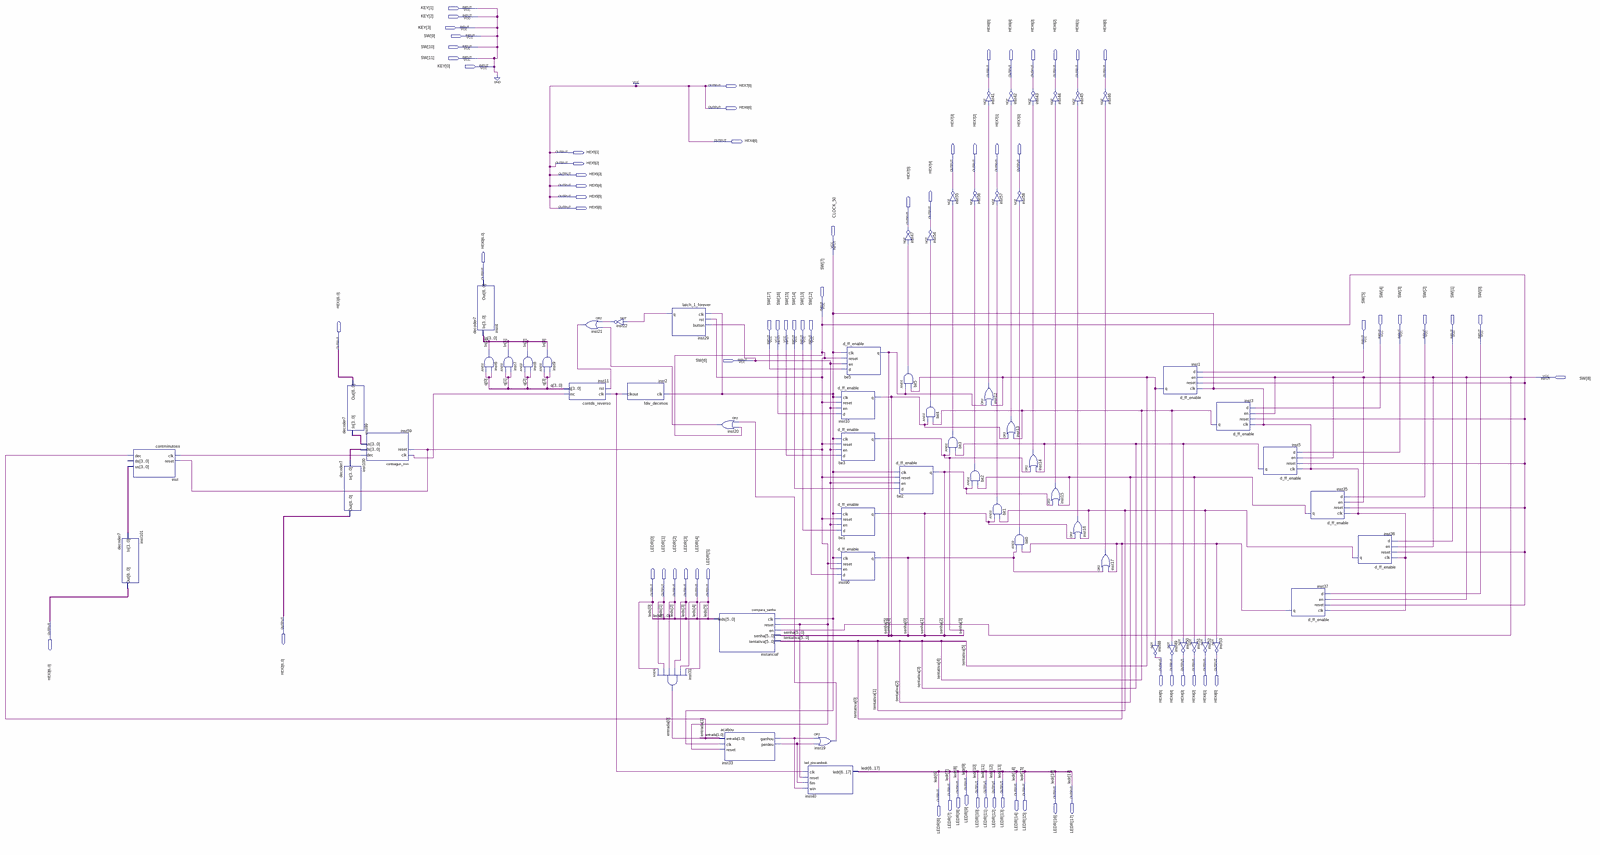
[diagram p0: schematic sheet, whole]
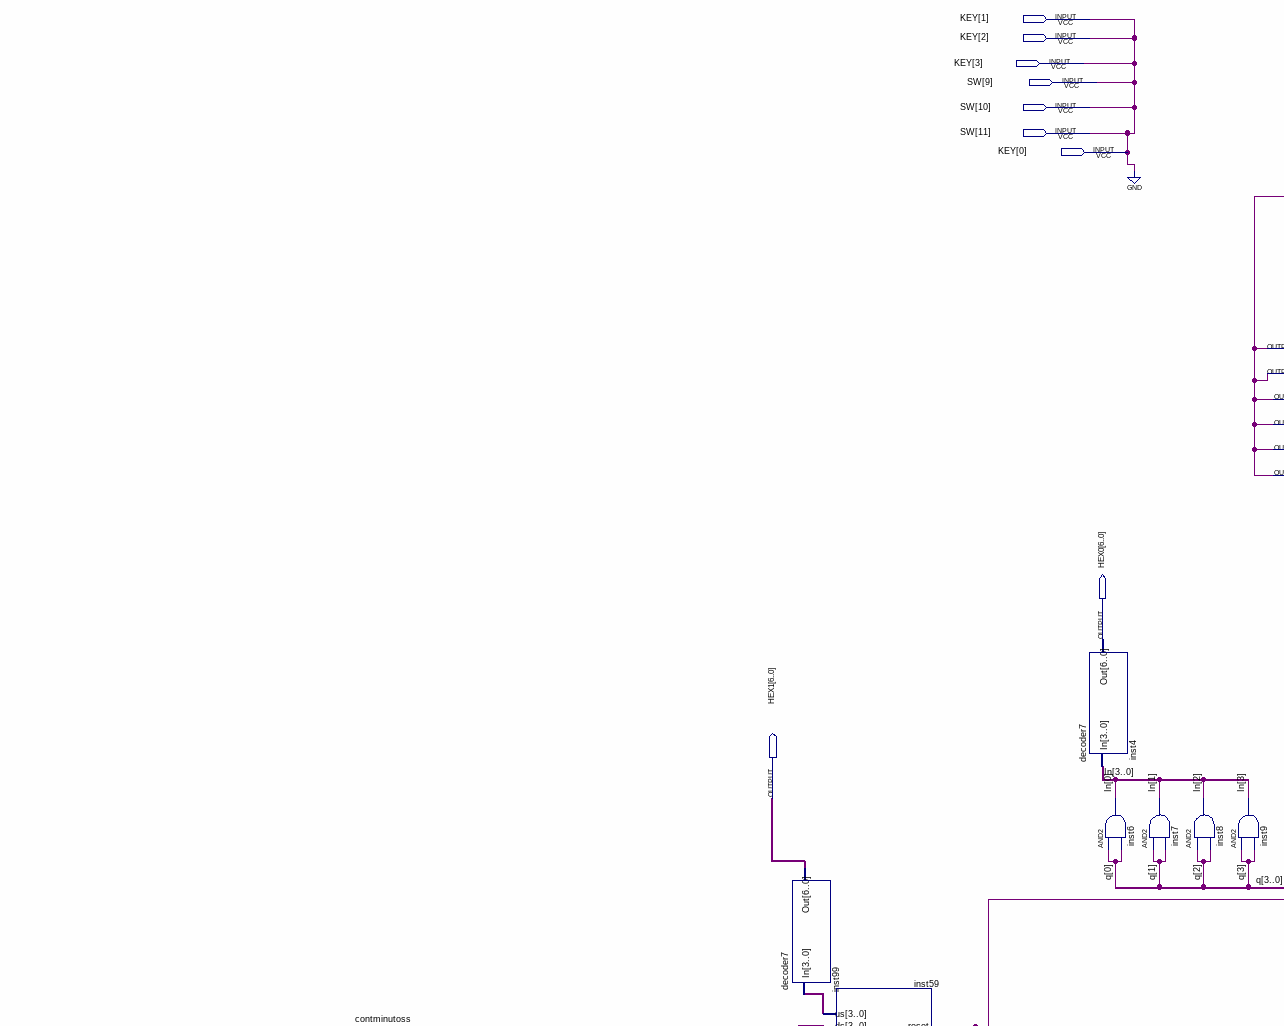
[diagram p1: schematic sheet, upper left part]
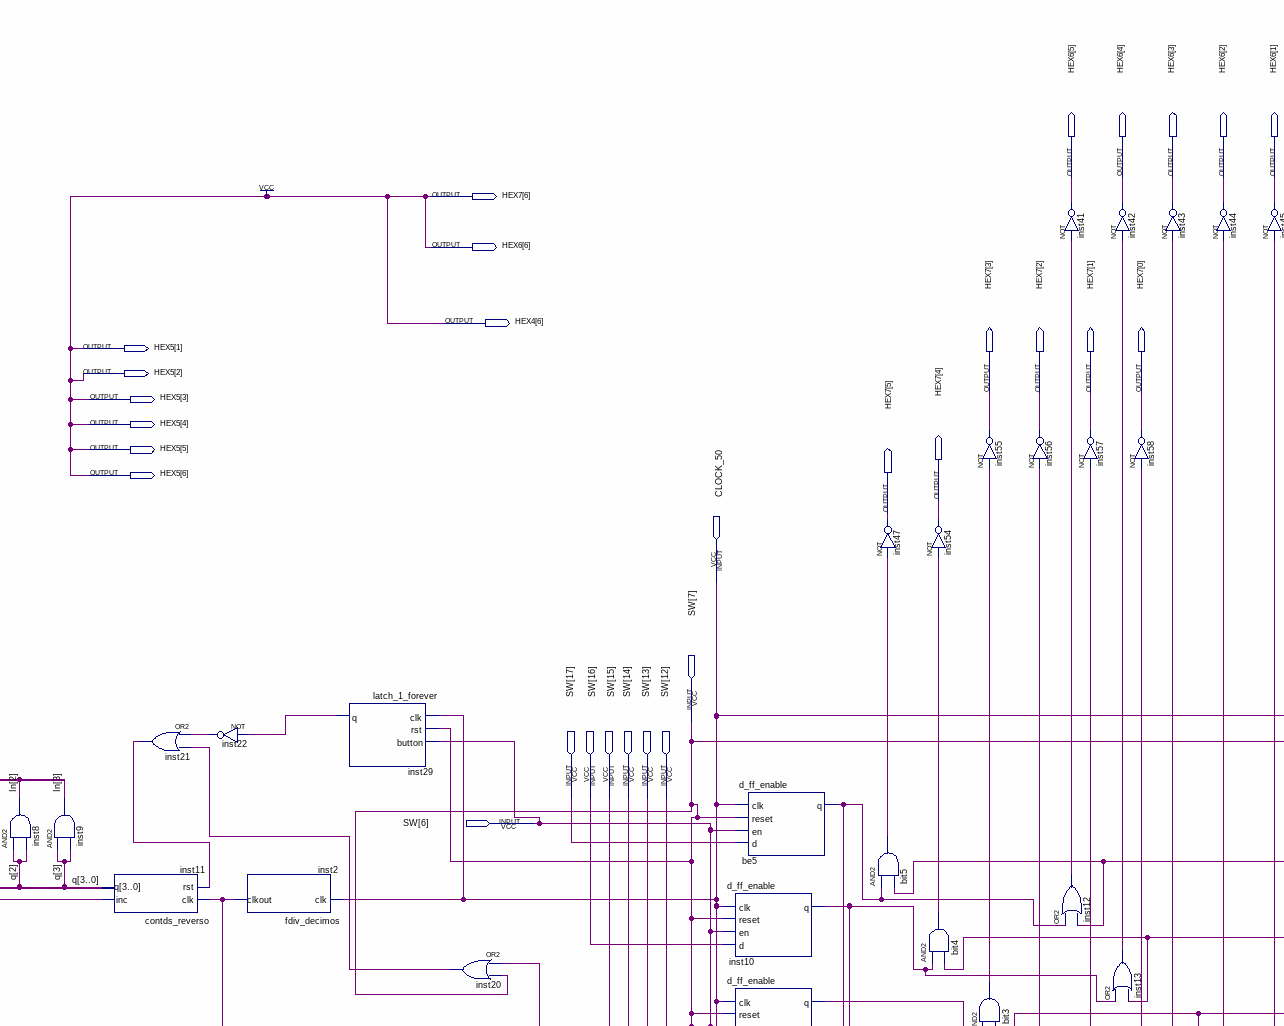
[diagram p2: schematic sheet, upper centre part]
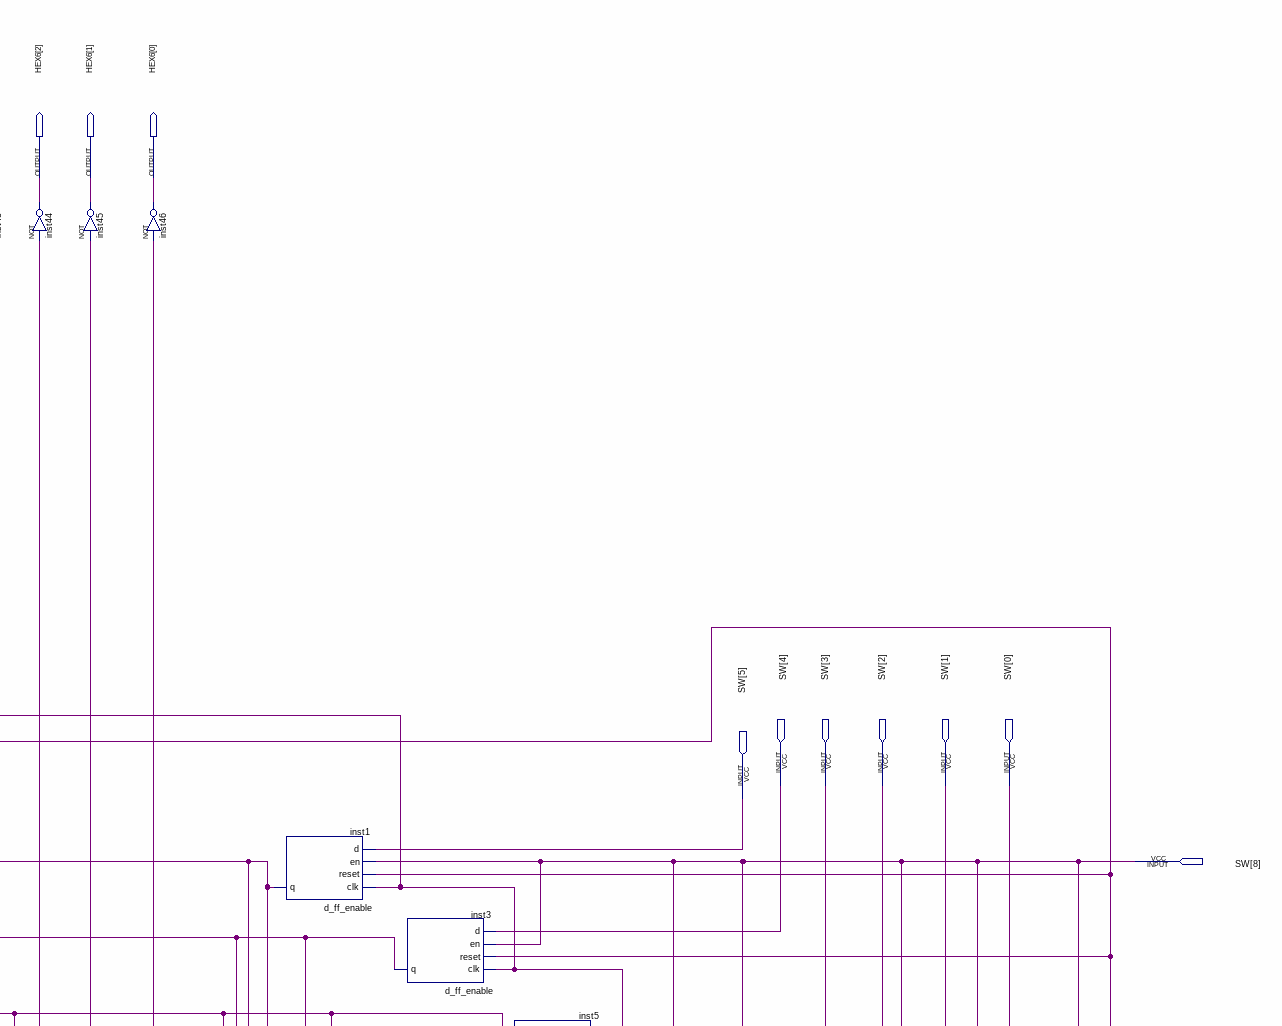
[diagram p3: schematic sheet, upper right part]
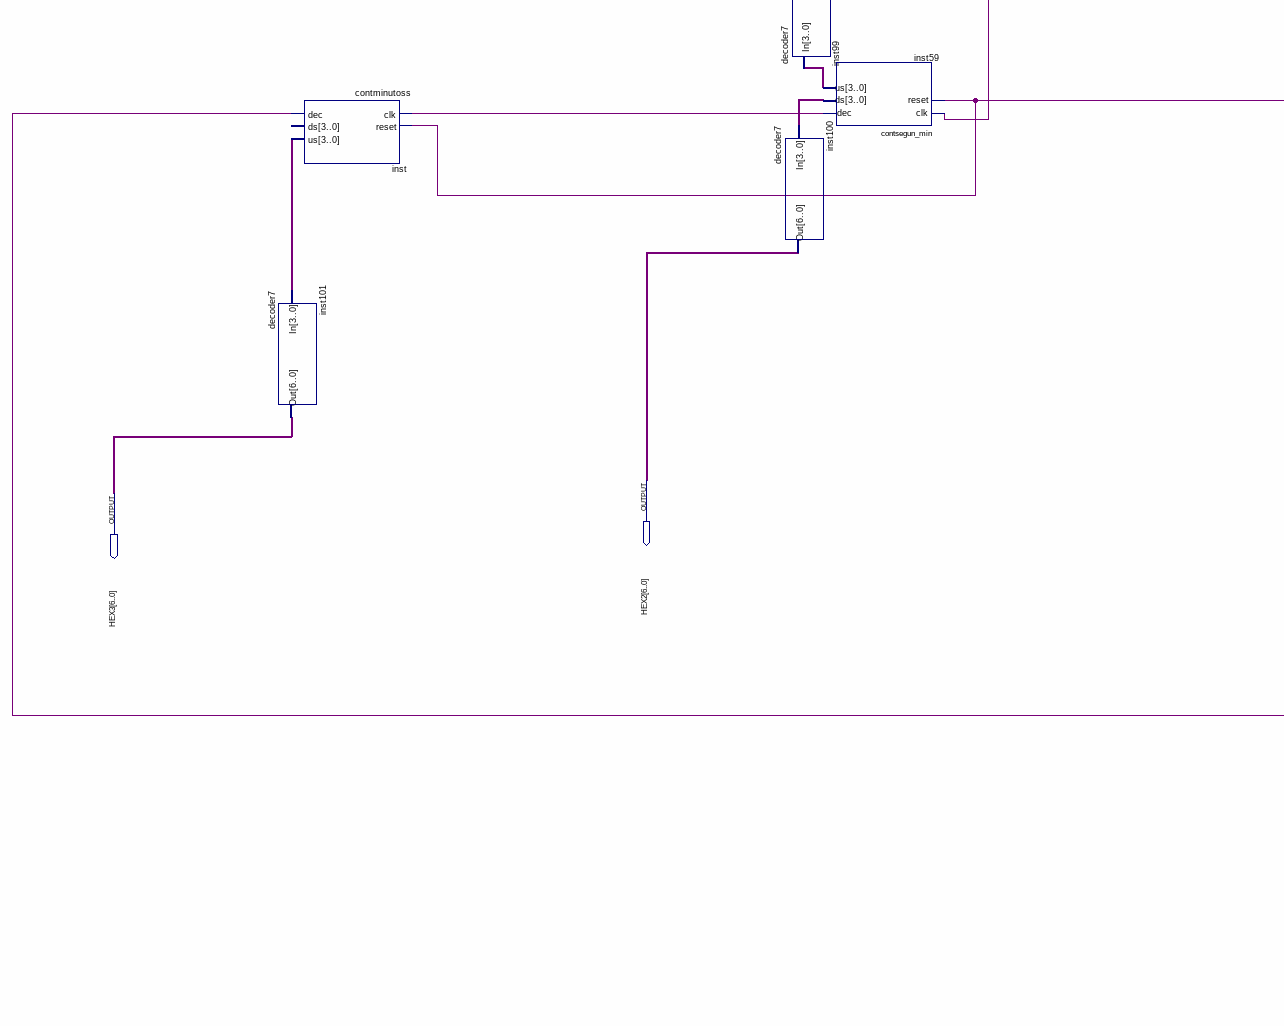
[diagram p4: schematic sheet, lower left part]
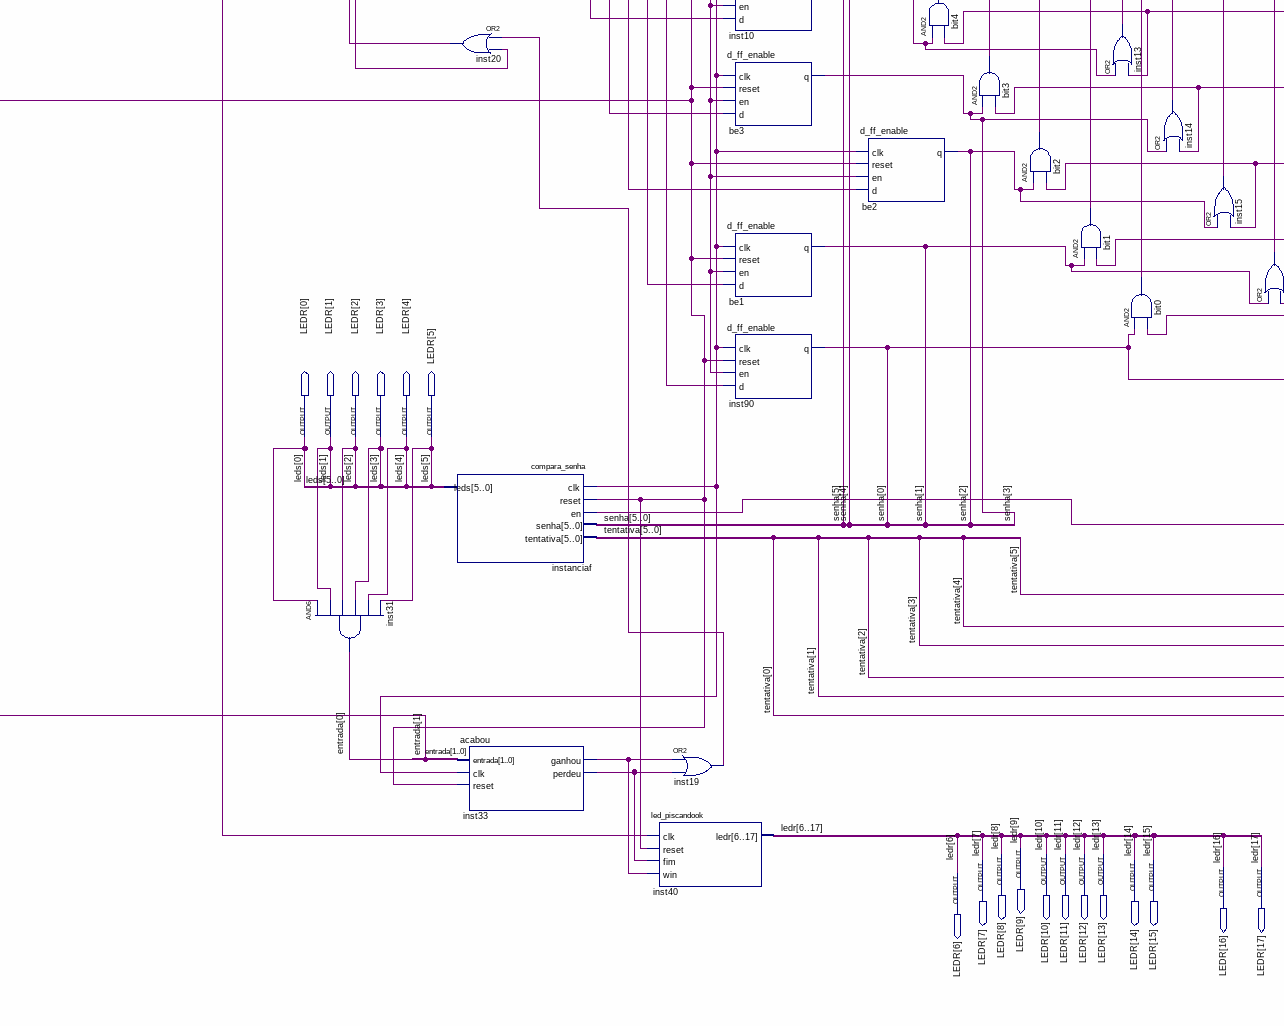
[diagram p5: schematic sheet, lower centre part]
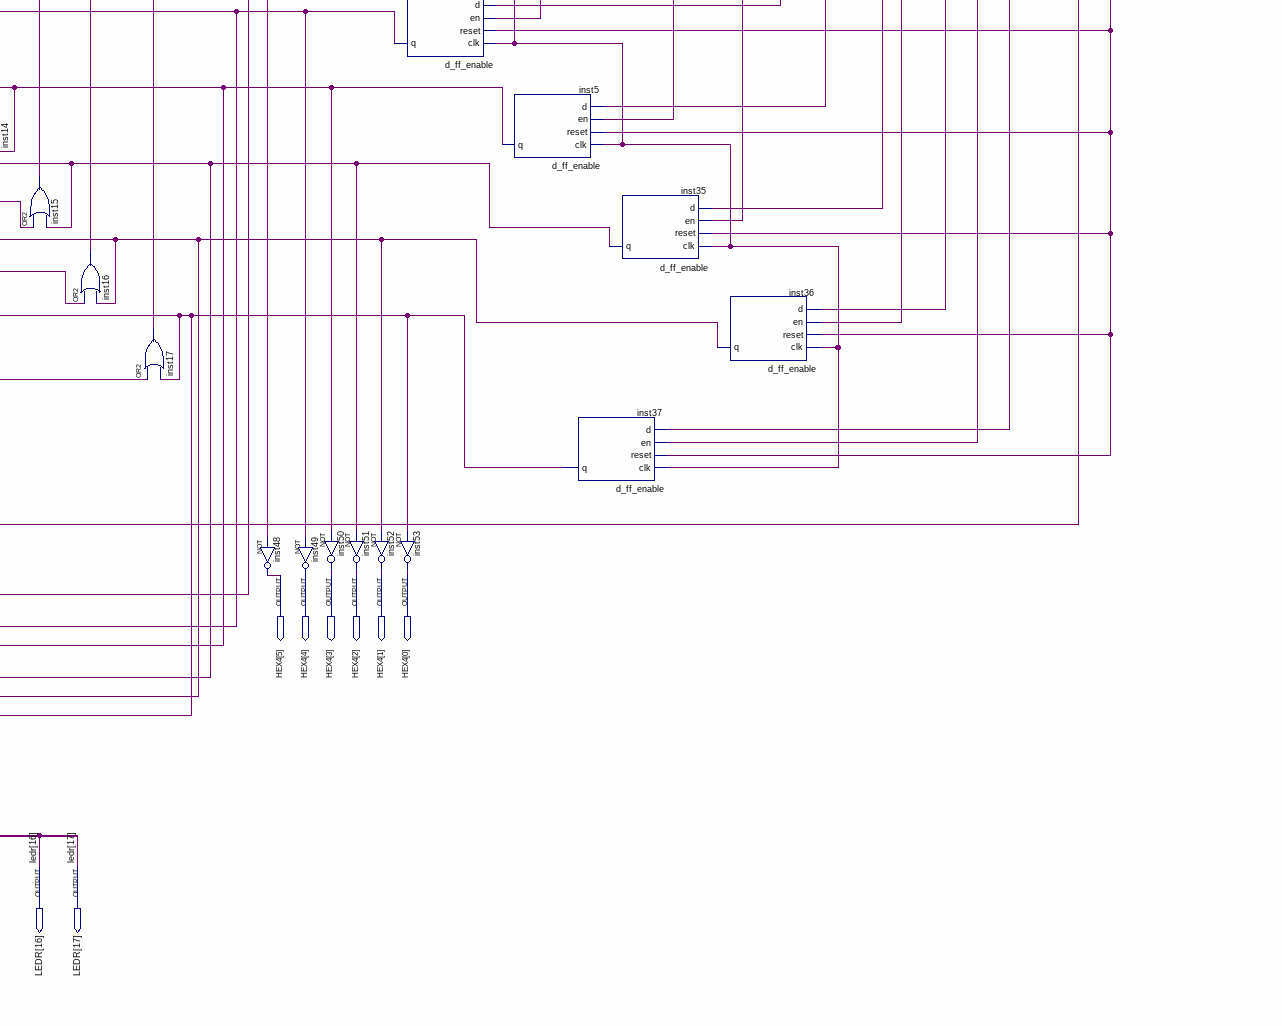
[diagram p6: schematic sheet, lower right part]
// Quartus schematic testando_maquina_de_estados.bdf as structural Verilog: 63 symbols, 72 pins
module testando_maquina_de_estados (
  input  [3:0] KEY,
  input  [17:0] SW,
  input  CLOCK_50,
  output [6:0] HEX6,
  output [6:0] HEX7,
  output [6:0] HEX4,
  output [6:1] HEX5,
  output [6:0] HEX0,
  output [6:0] HEX1,
  output [17:0] LEDR,
  output [6:0] HEX2,
  output [6:0] HEX3
);

  wire bit0_out, bit1_out, bit2_out, bit3_out, bit4_out, bit5_out, inst2_clkout, inst11_inc, inst12_out,
       inst13_out, inst14_out, inst15_out, inst16_out, inst17_out, inst19_out, inst20_out, inst21_out,
       inst22_out, inst29_q, inst33_ganhou, inst33_perdeu, inst59_dec;
  wire [1:0] entrada;
  wire [3:0] In, inst59_ds, inst59_us, inst_us, q;
  wire [5:0] senha, tentativa;

  contminutoss inst (.clk(inst59_dec), .reset(SW[7]), .dec(entrada[1]), .us(inst_us));  // open: ds
  decoder7 inst101 (.In(inst_us), .Out(HEX3));
  decoder7 inst99 (.In(inst59_us), .Out(HEX1));
  decoder7 inst100 (.In(inst59_ds), .Out(HEX2));
  contsegun_min inst59 (.clk(inst11_inc), .reset(SW[7]), .dec(inst59_dec), .ds(inst59_ds), .us(inst59_us));
  decoder7 inst4 (.In(In), .Out(HEX0));
  and inst6 (In[0], q[0], q[0]);
  and inst7 (In[1], q[1], q[1]);
  and inst8 (In[2], q[2], q[2]);
  and inst9 (In[3], q[3], q[3]);
  contds_reverso inst11 (.clk(inst2_clkout), .rst(inst21_out), .inc(inst11_inc), .q(q));
  or inst21 (inst21_out, inst22_out, inst20_out);
  not inst22 (inst22_out, inst29_q);
  fdiv_decimos inst2 (.clk(CLOCK_50), .clkout(inst2_clkout));
  and inst31 (entrada[0], LEDR[0], LEDR[1], LEDR[2], LEDR[3], LEDR[4], LEDR[5]);
  latch_1_forever inst29 (.clk(CLOCK_50), .rst(SW[7]), .button(SW[6]), .q(inst29_q));
  or inst20 (inst20_out, inst19_out, SW[7]);
  compara_senha instanciaf (
    .clk(CLOCK_50), .reset(SW[7]), .en(SW[8]), .senha(senha), .tentativa(tentativa), .leds(LEDR[5:0]));
  acabou inst33 (.entrada(entrada), .clk(CLOCK_50), .reset(SW[7]), .ganhou(inst33_ganhou), .perdeu(inst33_perdeu));
  or inst19 (inst19_out, inst33_ganhou, inst33_perdeu);
  led_piscandook inst40 (
    .clk(inst2_clkout), .reset(SW[7]), .fim(inst33_perdeu), .win(inst33_ganhou),
    .ledr({LEDR[6], LEDR[7], LEDR[8], LEDR[9], LEDR[10], LEDR[11], LEDR[12], LEDR[13], LEDR[14], LEDR[15], LEDR[16], LEDR[17]}));
  d_ff_enable be5 (.clk(CLOCK_50), .reset(SW[7]), .en(SW[6]), .d(SW[17]), .q(senha[5]));
  d_ff_enable inst10 (.clk(CLOCK_50), .reset(SW[7]), .en(SW[6]), .d(SW[16]), .q(senha[4]));
  d_ff_enable be3 (.clk(CLOCK_50), .reset(SW[7]), .en(SW[6]), .d(SW[15]), .q(senha[3]));
  d_ff_enable be1 (.clk(CLOCK_50), .reset(SW[7]), .en(SW[6]), .d(SW[13]), .q(senha[1]));
  d_ff_enable inst90 (.clk(CLOCK_50), .reset(SW[7]), .en(SW[6]), .d(SW[12]), .q(senha[0]));
  not inst47 (HEX7[5], bit5_out);
  and bit5 (bit5_out, senha[5], tentativa[5]);
  d_ff_enable be2 (.clk(CLOCK_50), .reset(SW[7]), .en(SW[6]), .d(SW[14]), .q(senha[2]));
  not inst54 (HEX7[4], bit4_out);
  and bit4 (bit4_out, senha[4], tentativa[4]);
  not inst55 (HEX7[3], bit3_out);
  and bit3 (bit3_out, senha[3], tentativa[3]);
  not inst56 (HEX7[2], bit2_out);
  and bit2 (bit2_out, senha[2], tentativa[2]);
  not inst41 (HEX6[5], inst12_out);
  not inst57 (HEX7[1], bit1_out);
  or inst12 (inst12_out, senha[5], tentativa[5]);
  and bit1 (bit1_out, senha[1], tentativa[1]);
  not inst42 (HEX6[4], inst13_out);
  not inst58 (HEX7[0], bit0_out);
  or inst13 (inst13_out, senha[4], tentativa[4]);
  and bit0 (bit0_out, senha[0], tentativa[0]);
  not inst43 (HEX6[3], inst14_out);
  or inst14 (inst14_out, senha[3], tentativa[3]);
  not inst44 (HEX6[2], inst15_out);
  or inst15 (inst15_out, senha[2], tentativa[2]);
  not inst45 (HEX6[1], inst16_out);
  or inst16 (inst16_out, senha[1], tentativa[1]);
  not inst46 (HEX6[0], inst17_out);
  or inst17 (inst17_out, senha[0], tentativa[0]);
  not inst48 (HEX4[5], tentativa[5]);
  d_ff_enable inst1 (.clk(CLOCK_50), .reset(SW[7]), .en(SW[8]), .d(SW[5]), .q(tentativa[5]));
  not inst49 (HEX4[4], tentativa[4]);
  not inst50 (HEX4[3], tentativa[3]);
  not inst51 (HEX4[2], tentativa[2]);
  d_ff_enable inst3 (.clk(CLOCK_50), .reset(SW[7]), .en(SW[8]), .d(SW[4]), .q(tentativa[4]));
  not inst52 (HEX4[1], tentativa[1]);
  not inst53 (HEX4[0], tentativa[0]);
  d_ff_enable inst5 (.clk(CLOCK_50), .reset(SW[7]), .en(SW[8]), .d(SW[3]), .q(tentativa[3]));
  d_ff_enable inst37 (.clk(CLOCK_50), .reset(SW[7]), .en(SW[8]), .d(SW[0]), .q(tentativa[0]));
  d_ff_enable inst35 (.clk(CLOCK_50), .reset(SW[7]), .en(SW[8]), .d(SW[2]), .q(tentativa[2]));
  d_ff_enable inst36 (.clk(CLOCK_50), .reset(SW[7]), .en(SW[8]), .d(SW[1]), .q(tentativa[1]));

  assign HEX4[6] = 1'b1;
  assign HEX5 = {6{1'b1}};
  assign HEX6[6] = 1'b1;
  assign HEX7[6] = 1'b1;
  assign KEY[2:0] = {3{KEY[3]}};
  assign SW[11:9] = {3{KEY[3]}};
  // also tied to GND on the sheet: KEY[3]

  // Other names for the same wires on the sheet: leds[5:0] = LEDR[5:0]
endmodule
